# Altium schematic sheet 10_USB_Connectors.SchDoc
size A3; SheetNumber: 20; SheetTotal: 21
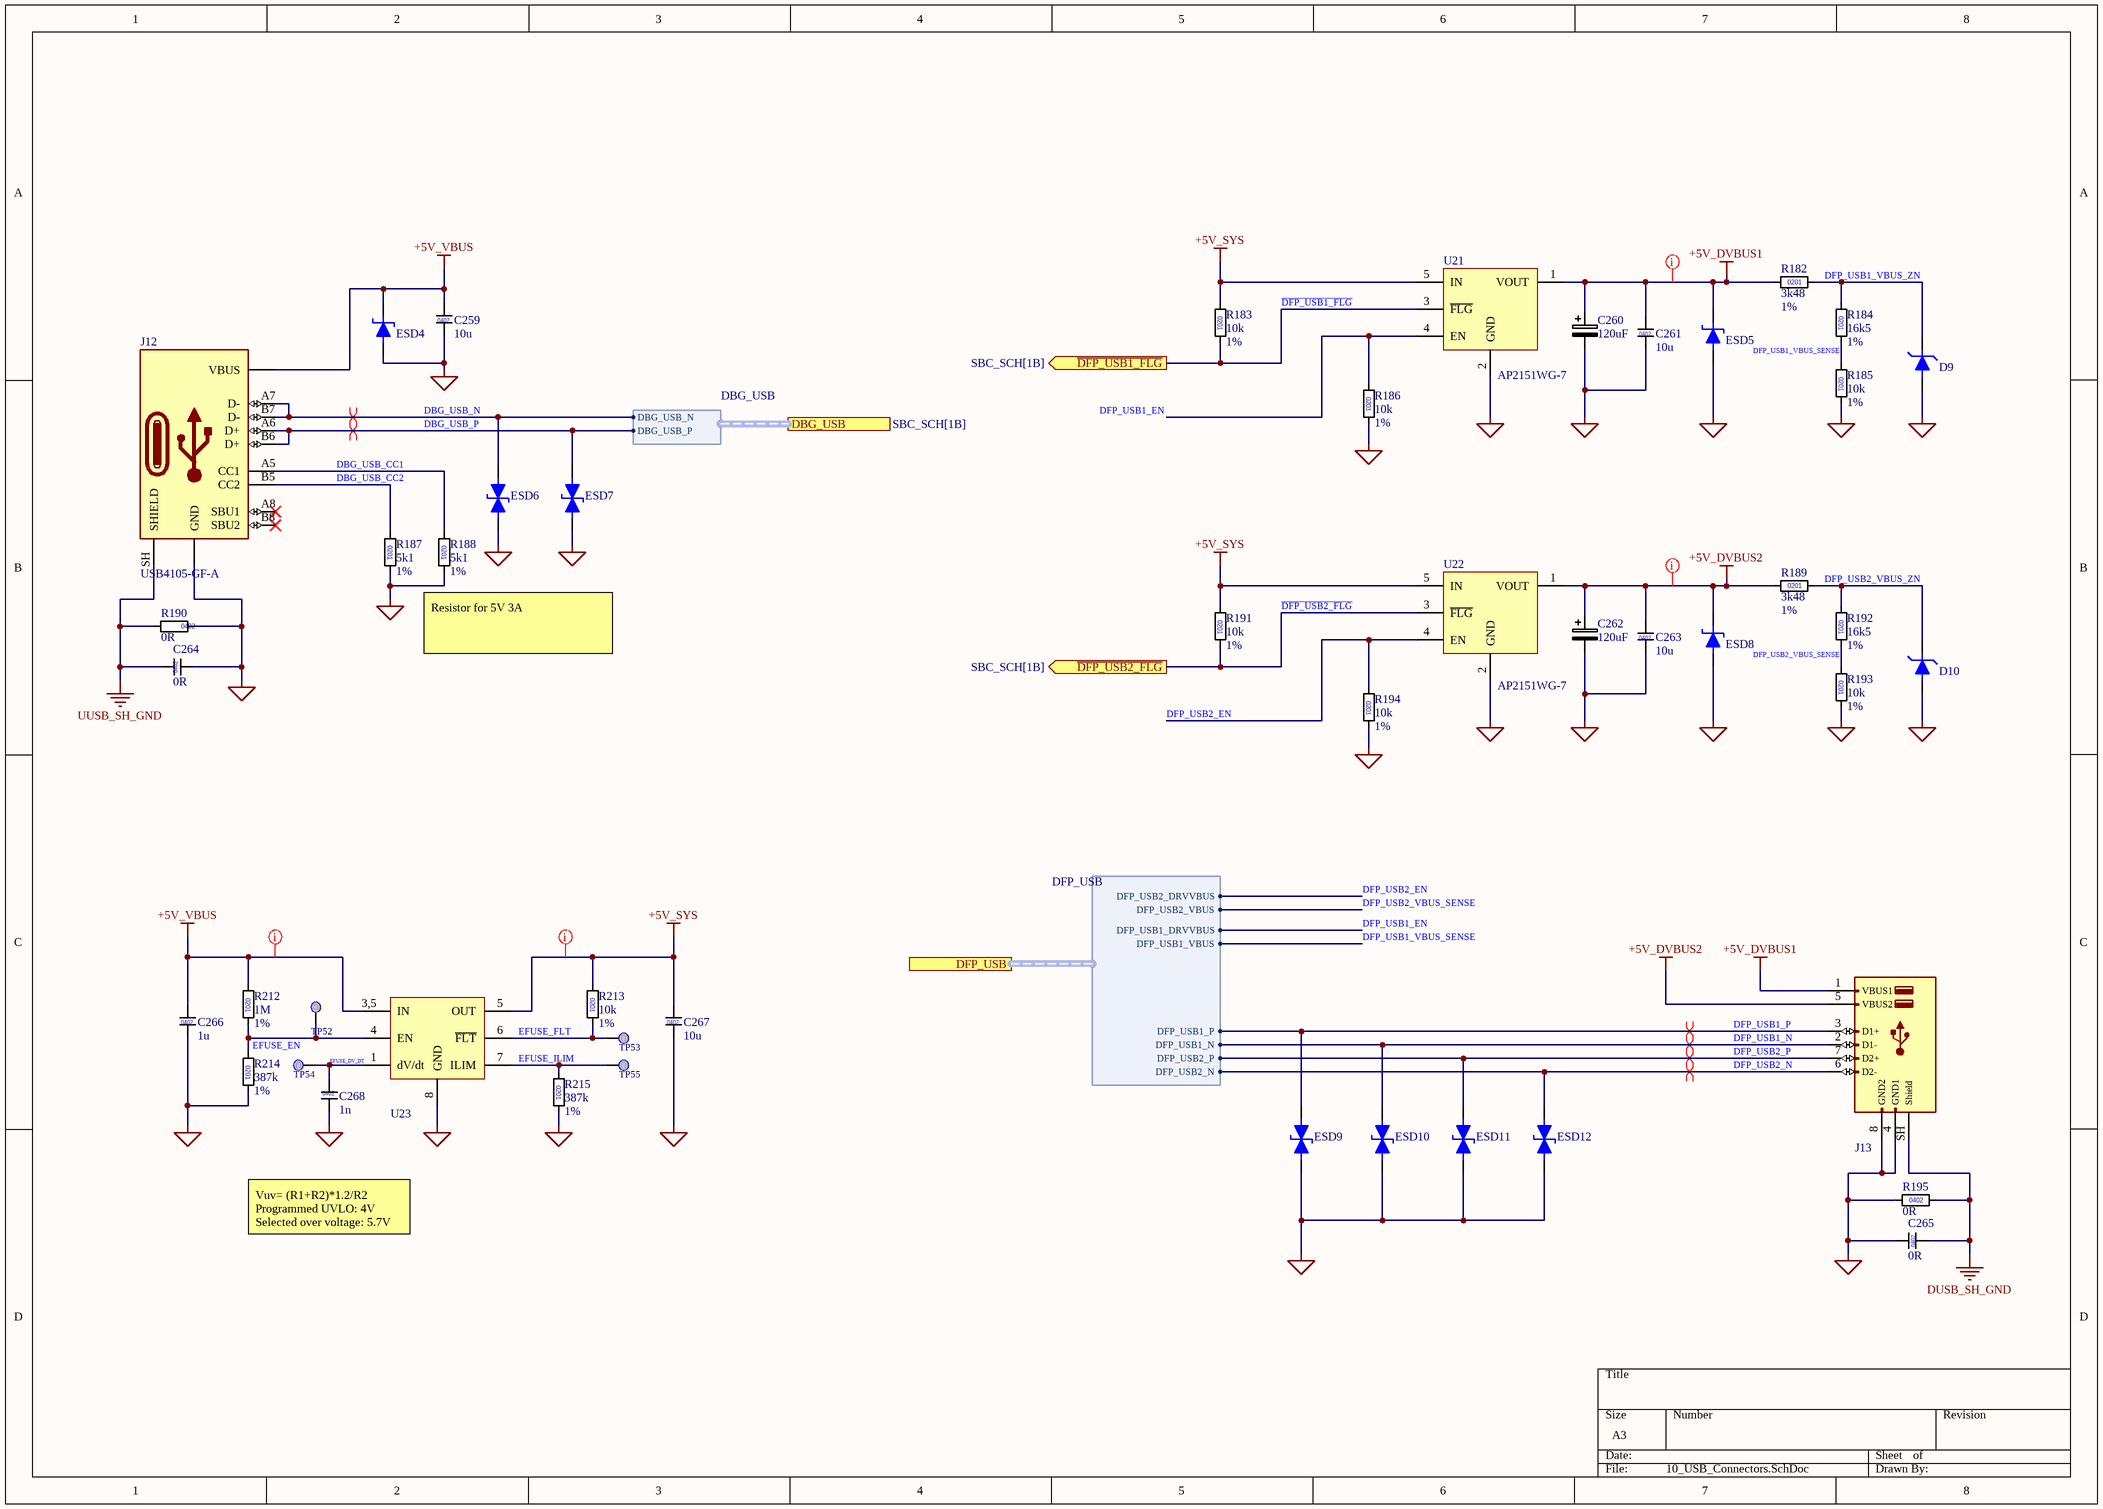
[diagram p0: 10_USB_Connectors.SchDoc]

## Parts
C259  value 10u  [C0402]  (hidden comment: 4u7)
C260  value 120uF  (hidden comment: C_Polarized)
C261  value 10u  [C0402]  (hidden comment: 4u7)
C262  value 120uF  (hidden comment: C_Polarized)
C263  value 10u  [C0402]  (hidden comment: 4u7)
C264  value 0R  [C0402]  (hidden comment: C_0402)
C265  value 0R  [C0402]  (hidden comment: C_0402)
C266  value 1u  [C0402]  (hidden comment: 4u7)
C267  value 10u  [C0402]  (hidden comment: 4u7)
C268  value 1n  [C0402]  (hidden comment: C_0402)
D9  D_Filled  [D_SOD-523]  (value not drawn)
D10  D_Filled  [D_SOD-523]  (value not drawn)
ESD4  ESD  [D_SOD-923]  (value not drawn)
ESD5  ESD  [D_SOD-923]  (value not drawn)
ESD6  D_Filled  [ESD341]  (value not drawn)
ESD7  D_Filled  [ESD341]  (value not drawn)
ESD8  ESD  [D_SOD-923]  (value not drawn)
ESD9  D_Filled  [ESD341]  (value not drawn)
ESD10  D_Filled  [ESD341]  (value not drawn)
ESD11  D_Filled  [ESD341]  (value not drawn)
ESD12  D_Filled  [ESD341]  (value not drawn)
J12  value USB4105-GF-A  [USB_C_Receptacle_GCT_USB4105-xx-A_16P_TopMnt_Horizontal]  (hidden comment: USB_C_Receptacle_USB2.0_16P)
J13  USB_A_Stacked  [USB_A_CUI_UJ2-ADH-TH_Horizontal_Stacked]  (value not drawn)
R182  value 3k48  Tolerance: 1%  [R0201]  (hidden comment: 0201)
R183  value 10k  Tolerance: 1%  [R0201]  (hidden comment: 0201)
R184  value 16k5  Tolerance: 1%  [R0201]  (hidden comment: 0201)
R185  value 10k  Tolerance: 1%  [R0201]  (hidden comment: 0201)
R186  value 10k  Tolerance: 1%  [R0201]  (hidden comment: 0201)
R187  value 5k1  Tolerance: 1%  [R0201]  (hidden comment: 0201)
R188  value 5k1  Tolerance: 1%  [R0201]  (hidden comment: 0201)
R189  value 3k48  Tolerance: 1%  [R0201]  (hidden comment: 0201)
R190  value 0R  [R0402]  (hidden comment: 0402)
R191  value 10k  Tolerance: 1%  [R0201]  (hidden comment: 0201)
R192  value 16k5  Tolerance: 1%  [R0201]  (hidden comment: 0201)
R193  value 10k  Tolerance: 1%  [R0201]  (hidden comment: 0201)
R194  value 10k  Tolerance: 1%  [R0201]  (hidden comment: 0201)
R195  value 0R  [R0402]  (hidden comment: 0402)
R212  value 1M  Tolerance: 1%  [R0201]  (hidden comment: 0201)
R213  value 10k  Tolerance: 1%  [R0201]  (hidden comment: 0201)
R214  value 387k  Tolerance: 1%  [R0201]  (hidden comment: 0201)
R215  value 387k  Tolerance: 1%  [R0201]  (hidden comment: 0201)
TP52  Testpoint 0.5mm  [TP_0.50mm]  (value not drawn)  (no BOM)
TP53  Testpoint 0.5mm  [TP_0.50mm]  (value not drawn)  (no BOM)
TP54  Testpoint 0.5mm  [TP_0.50mm]  (value not drawn)  (no BOM)
TP55  Testpoint 0.5mm  [TP_0.50mm]  (value not drawn)  (no BOM)
U21  AP2151WG-7  [SOT-23-5]
U22  AP2151WG-7  [SOT-23-5]
U23  TPS259531  [TPS259531]  (value not drawn)

## Ports
DBG_USB (harness DBG_USB, see SBC_SCH[1B]), DFP_USB (harness DFP_USB, see SBC_SCH[1B]), ~{DFP_USB1_FLG} (out, see SBC_SCH[1B]), ~{DFP_USB2_FLG} (out, see SBC_SCH[1B])

## Harnesses
DBG_USB: DBG_USB_N, DBG_USB_P
DFP_USB: DFP_USB1_DRVVBUS, DFP_USB1_VBUS, DFP_USB2_DRVVBUS, DFP_USB2_VBUS, DFP_USB1_P, DFP_USB1_N, DFP_USB2_P, DFP_USB2_N

## Nets
+5V_DVBUS1: C260.1 C261.1 ESD5.1(K) J13.1(VBUS1) R182.1 U21.1(VOUT)
+5V_DVBUS2: C262.1 C263.1 ESD8.1(K) J13.5(VBUS2) R189.1 U22.1(VOUT)
+5V_SYS: C267.1 R183.1 R191.1 R213.1 U21.5(IN) U22.5(IN) U23.5(OUT)
+5V_VBUS: C259.1 C266.1 ESD4.1(K) J12.A4,A9,B4,B9(VBUS) R212.1 U23.3,5(IN)
DUSB_SH_GND: C265.2 J13.SH(Shield) R195.R?
GND: C259.2 C260.2 C261.2 C262.2 C263.2 C264.1 C265.1 C266.2 C267.2 C268.1 D9.2(A) D10.2(A) ESD4.2(A) ESD5.2(A) ESD6.1(K) ESD7.1(K) ESD8.2(A) ESD9.1(K) ESD10.1(K) ESD11.1(K) ESD12.1(K) J12.A1,A12,B1,B12(GND) J13.4(GND1) J13.8(GND2) R185.2 R186.2 R187.2 R188.2 R190.1 R193.2 R194.2 R195.1 R214.2 R215.2 U21.2(GND) U22.2(GND) U23.8(GND)
UUSB_SH_GND: C264.2 J12.SH(SHIELD) R190.R?
~{DFP_USB1_FLG}: R183.2 U21.3(~{FLG}) ; port ~{DFP_USB1_FLG}
~{DFP_USB2_FLG}: R191.2 U22.3(~{FLG}) ; port ~{DFP_USB2_FLG}
DBG_USB_CC1: J12.A5(CC1) R188.1
DBG_USB_CC2: J12.B5(CC2) R187.1
DBG_USB_N: ESD6.2(A) J12.A7(D-) J12.B7(D-) ; port DBG_USB.DBG_USB_N
DBG_USB_P: ESD7.2(A) J12.A6(D+) J12.B6(D+) ; port DBG_USB.DBG_USB_P
DFP_USB1_EN: R186.1 U21.4(EN) ; port DFP_USB.DFP_USB1_DRVVBUS
DFP_USB1_N: ESD10.2(A) J13.2(D1-) ; port DFP_USB.DFP_USB1_N
DFP_USB1_P: ESD9.2(A) J13.3(D1+) ; port DFP_USB.DFP_USB1_P
DFP_USB1_VBUS_SENSE: R184.2 R185.1 ; port DFP_USB.DFP_USB1_VBUS
DFP_USB1_VBUS_ZN: D9.1(K) R182.2 R184.1
DFP_USB2_EN: R194.1 U22.4(EN) ; port DFP_USB.DFP_USB2_DRVVBUS
DFP_USB2_N: ESD12.2(A) J13.6(D2-) ; port DFP_USB.DFP_USB2_N
DFP_USB2_P: ESD11.2(A) J13.7(D2+) ; port DFP_USB.DFP_USB2_P
DFP_USB2_VBUS_SENSE: R192.2 R193.1 ; port DFP_USB.DFP_USB2_VBUS
DFP_USB2_VBUS_ZN: D10.1(K) R189.2 R192.1
EFUSE_DV_DT: C268.2 TP54.TP U23.1(dV/dt)
EFUSE_EN: R212.2 R214.1 TP52.TP U23.4(EN)
EFUSE_FLT: R213.2 TP53.TP U23.6(~{FLT})
EFUSE_ILIM: R215.1 TP55.TP U23.7(ILIM)

Not connected (* = marked no-connect by the designer): J12 A8(SBU1)* B8(SBU2)*

## Layout directives
differential pair: DBG_USB_N, DBG_USB_P, DFP_USB1_N, DFP_USB1_P, DFP_USB2_N, DFP_USB2_P
net class PWR: +5V_DVBUS1, +5V_DVBUS2, +5V_SYS, +5V_VBUS

## Notes on the sheet
- Resistor for 5V 3A
- Vuv= (R1+R2)*1.2/R2
  Programmed UVLO: 4V
  Selected over voltage: 5.7V
- (in symbol C_0402) 0402

## Library data of the parts
C259 C261 C263-C268 = C_0402: MLCC 0402; Manufacturer_Name: *; Manufacturer_Part_Number: *
C260 C262 = C_Polarized: Polarized capacitor; Manufacturer_Name: *; Manufacturer_Part_Number: *
D9 D10 = D_Zener: Diode, filled shape; Manufacturer_Name: Panjit International Inc.; Value: BAT54TS_R1_00001; Manufacturer Part Number: BAT54TS_R1_00001
ESD4 ESD5 ESD8 = D_ESDU: ESD diode uni-directional; Manufacturer_Name: TOSHIBA; Value: DF2S8.2FS,L3M; Manufacturer Part Number: DF2S8.2FS,L3M
ESD6 ESD7 ESD9-ESD12 = D_ESDB: ESD diode bi-directional; Manufacturer_Name: TECH PUBLIC; Value: ESD341DPLR; Manufacturer Part Number: ESD341DPLR
J12 = USB_C_Receptacle_USB2.0_16P: USB 2.0-only 16P Type-C Receptacle connector; Manufacturer_Name: GCT; Datasheet: https://www.usb.org/sites/default/files/documents/usb_type-c.zip; ComponentLink1Description: Datasheet; ComponentLink1URL: https://www.usb.org/sites/default/files/documents/usb_type-c.zip; Manufacturer_Part_Number: USB4105-GF-A
J13 = USB_A_Stacked: USB Type A connector, stacked; Manufacturer_Name: SHOU HAN; Value: AF SS-JB17.6; Manufacturer_Part_Number: AF SS-JB17.6
R182-R189 R191-R194 R212-R215 = R_0201: Manufacturer_Name: *; Manufacturer_Part_Number: *
R190 R195 = R_0402: Tolerance: 1%; Manufacturer_Name: *; Manufacturer_Part_Number: *
U21 U22 = AP2151WG-7: Linear Voltage Regulator IC Positive Fixed 1 Output 300mA SOT-25; Manufacturer_Name: Diodes Incorporated; Manufacturer_Part_Number: AP2151WG-7; Value: AP2151WG-7
U23 = TPS259531: E-Fuse 34mΩ Integrated FET Surface Mount WSON-8-EP(2x2); Manufacturer_Name: Texas Instruments; Manufacturer_Part_Number: TPS259531DSGR; Value: TPS259531